# Altium project QKD-LD-002.PrjPcb
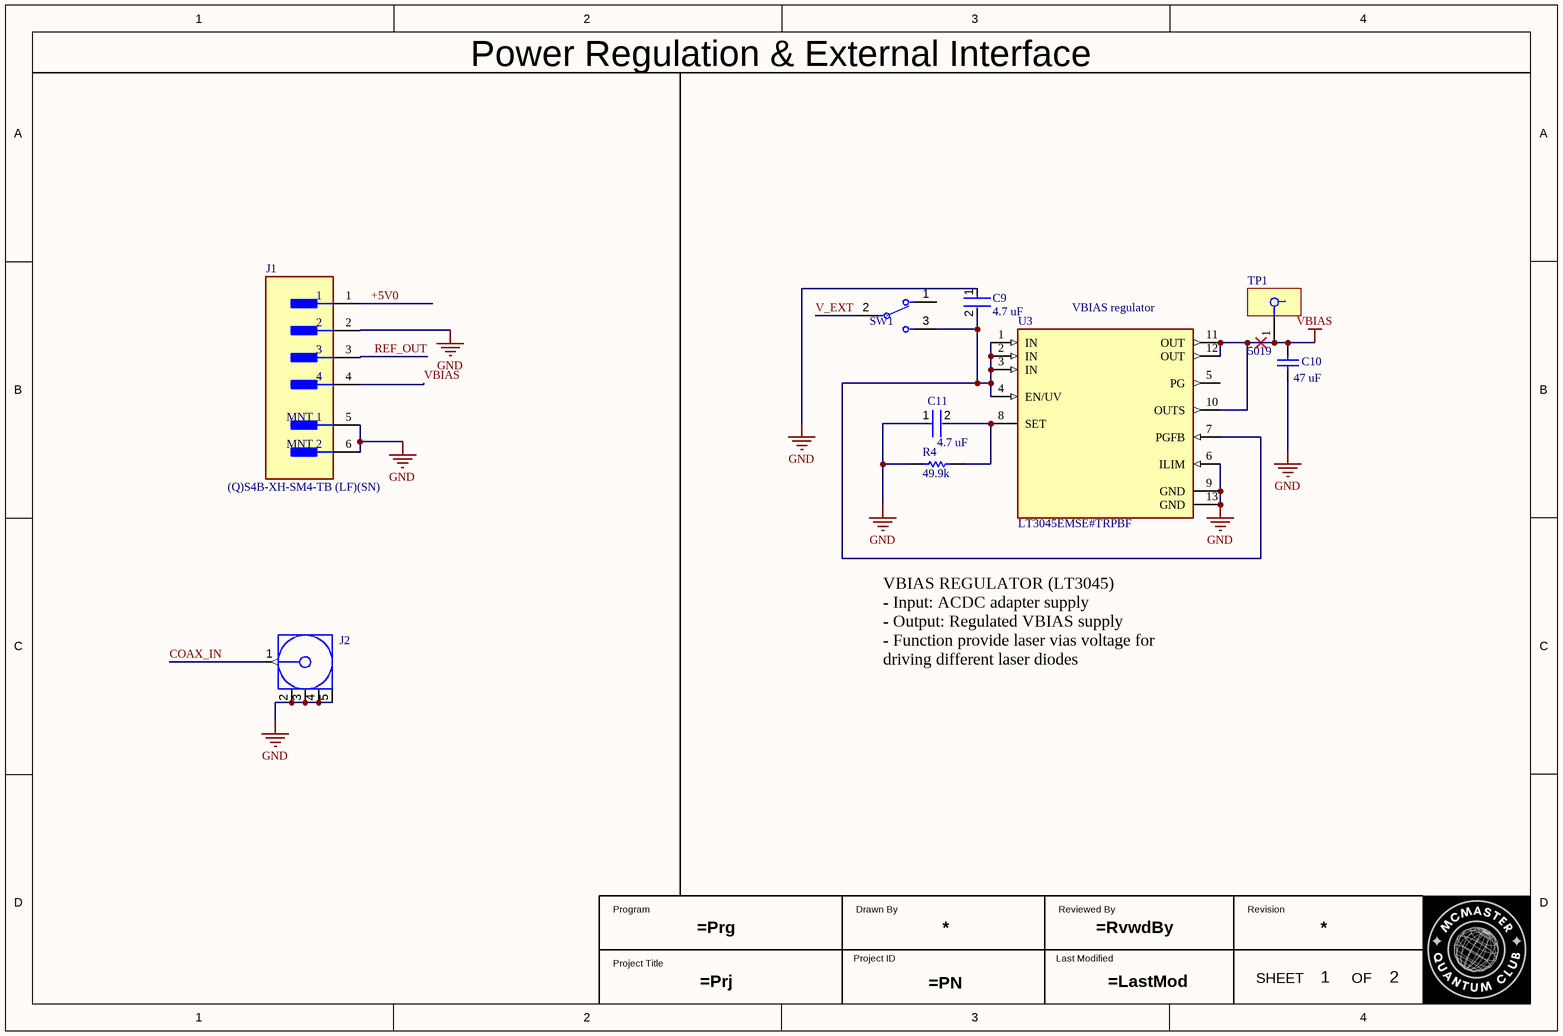
[diagram p0: Power Regulation and Interfaces.SchDoc]
2 sheets, 24 parts. Net scope: global (net labels, ports and power ports of the same name join across sheets).
Sheets:
  Power Regulation and Interfaces.SchDoc
  Laser Driver.SchDoc

## Sheet Power Regulation and Interfaces.SchDoc
size A4; SheetNumber: 1; SheetTotal: 2; SPICEModelCacheAAATKUSZ: <root> / <DocumentId>AAATKUSZ</DocumentId> / <CacheFrame Number="0"> / <Model Name="emk325b7475_nht" Kind="CKT"> / <Text>* EMK325B7475_NHT     SPICE MODEL  ( General Type ) / *-------------------------------------------------------------------------------------------------------- / * Model Generated by TAIYO YUDEN Corporation (http://www.ty-top.com) / * Version 1.0 / * TAIYO YUDEN Control No. 170613 / * Copyright(c) 2017 TAIYO YUDEN CO.,LTD. All Rights Reserved. / *-------------------------------------------------------------------------------------------------------- / * / * Products Name : Multilayer Ceramic Capacitors / * / * Characteristics : / *     Capacitance : 4.7 uF , Rated Voltage : 16V , TCC : X7R / *     Case Size : 3.2 x 2.5 / 0.126 x 0.098 [mm/inch] , Thickness : 1.9 / 0.075 [mm/inch] / *     (Conditions: Temperature = 25 degC , DC Bias Current/Voltage = 0A / 0V) / * / * Frequency Range : 40Hz - 3GHz / * / * External Node Assignments : / * / *  1  o---| |---o  2 / * / *-------------------------------------------------------------------------------------------------------- / .SubCkt EMK325B7475_NHT 1 2 / **************************** / C0 1 110 4.4322u / Cm 1 101 0.18549u / C1 101 102 0.5166u / Rc1 101 102 1.212k / C2 102 103 0.23246u / Rc2 102 103 324.4 / C3 103 110 0.044161u / Rc3 103 110 17.632 / C2m 1 301 0.22169u / C21 301 302 1.4263u / Rc21 301 302 2.8865k / C22 302 303 0.94554u / Rc22 302 303 3.6708k / C23 303 304 0.89694u / Rc23 303 304 3.8182k / C24 304 305 0.63775u / Rc24 304 305 327.79 / C25 305 306 0.52201u / Rc25 305 306 313.07 / C26 306 307 0.23625u / Rc26 306 307 60.171 / C27 307 308 0.21382u / Rc27 307 308 30.452 / C28 308 309 0.12573u / Rc28 308 309 51.023 / C29 309 110 4272.8p / Rc29 309 110 13.367 / Rp0 1 110 106.382978723404Meg / L0 110 120 0.15544n / Lm 120 130 0.41806n / L1 120 121 0.46753n / RL1 121 130 0.26517 / L2 120 122 0.47905n / RL2 122 130 0.25841 / L3 120 123 0.81633n / RL3 123 130 40.755 / CR 120 124 1.2488u / LR 124 125 0.3236n / RR 125 130 24.837m / CL 130 140 3.3935p / LL 130 140 0.14146n / RL 130 140 14.873 / Rs 140 2 4.0745m / **************************** / .ends EMK325B7475_NHT</Text> / </Model> / </CacheFrame> / </root>

### Parts
C9  4.7 uF  [FP-1210-L_3_2_0_3-W_2_5_0-MFG]
C10  47 uF  [WCAP-CSGP_1206_L3.2W1.6H1.6]
C11  4.7 uF  [FP-1210-L_3_2_0_3-W_2_5_0-MFG]
J1  (Q)S4B-XH-SM4-TB (LF)(SN)  [FP-Q_S4B-XH-SM4-TB_LF-MFG]
J2  60312242114510  [60312242114510]  (value not drawn)
R4  49.9k  [RESC1005X40X25NL05T05]
SW1  JS102011SAQN  [FP-JS102011SAQN-MFG]  (value not drawn)
TP1  5019  [5019_MFG]
U3  LT3045EMSE#TRPBF  [FP-MSE-12-05-08-1666-IPC_B]

### Nets
+5V0: C9.1 C10.1 C11.1 J1.1 J1.2 J1.5(MNT_1) J1.6(MNT_2) J2.2(GND) J2.3(GND) J2.4(GND) J2.5(GND) R4.1 U3.6(ILIM) U3.9(GND) U3.13(GND)  [also labelled GND]
VBIAS: C10.2 J1.4 TP1.1 U3.10(OUTS) U3.11(OUT) U3.12(OUT)
COAX_IN: J2.1(Signal)
REF_OUT: J1.3
V_EXT: SW1.2(C)
NetC9_2: C9.2 SW1.3 U3.1(IN) U3.2(IN) U3.3(IN) U3.4(EN/UV) U3.7(PGFB)
NetC11_2: C11.2 R4.2 U3.8(SET)

Not connected (* = marked no-connect by the designer): SW1 1; U3 5(PG)

### Notes on the sheet
- Power Regulation & External Interface
- (near U3) VBIAS regulator
- Type @ to refer to a designator
- VBIAS REGULATOR (LT3045)
  - Input: ACDC adapter supply
  - Output: Regulated VBIAS supply
  - Function provide laser vias voltage for driving different laser diodes
- Program
- Drawn By
- Reviewed By
- Revision
- Project Title
- Project ID
- Last Modified
- SHEET
- OF

### Library data of the parts
C9 C11 = CMP-14477-002952-2: None; RoHS Compliant: Yes
C10 = CMP-03913-65419936-2: 4.7μF ±10% 25V Ceramic Capacitor X7R 1206 (3216 Metric); Insulation Resistance: 100MΩ; Mount: Surface Mount; Tolerance: 10%; Min Operating Temperature: -55°C; Case Code (Imperial): 1206; RoHS: Compliant; Case Code (Metric): 3216; Case/Package: 1206; Voltage Rating: 25V; Length: 3.2mm; Capacitance: 4.7µF; Thickness: 1.905mm; Height: 1.6mm; Max Operating Temperature: 125°C; Width: 1.6mm
J1 = CMP-17439-000477-1: CONN HEADER SMD R/A 4POS 2.5MM
J2 = CMP-03913-97004434-3: Rf Coax Conn, Sma Jack, 50 Ohm, Pcb Rohs Compliant: Yes; Insertion Loss (dB): 0.14dB; Impedance: 50Ω; Insulation Resistance: 5GΩ; Orientation: Straight; Connector Type: SMA; Max Operating Temperature: 165°C; Insulation Material: PTFE; Min Operating Temperature: -65°C
R4 = CMP-2002-00036-1: Manufacturer: Vishay Dale; Part Number: CRCW0402499KFKTD
SW1 = CMP-2000-06501-2: SWITCH SLIDE SPDT 300MA 6V; Switch Function: On-On; Illumination Type: Non-Illuminated; Switch Travel: 2mm; Contact Resistance: 70mR; Actuator Material: Nylon; Electrical Life: 5000Cycles; Actuator Type: Standard; Max Operating Temperature: 85°C; Housing Material: Nylon; Radiation Hardening: No; Max Voltage Rating (DC): 6V; Package Quantity: 1; Case/Package: 100; Actuator Length: 2mm; Min Operating Temperature: -40°C; Contact Current Rating: 300mA; REACH SVHC: No SVHC; Throw Configuration: SPDT; Packaging: Tape and Reel; Contact Material: Copper Alloy; Max Current Rating: 300mA; Current Rating: 300mA; Mount: Surface Mount; Lead Free: Lead Free; Termination: Gull Wing; Voltage Rating (DC): 6V; Length: 9mm; Orientation: Right Angle; Contact Plating: Silver
TP1 = CMP-1672-00008-3: Phosphor Bronze Contact Miniature Silver Plated Surface Mount Test Points; Number of Contacts: 1; ComponentLink1Description: Manufacturer's Website; Number of Pins: 1; Height: 2.42mm; Mount: Surface Mount; HelpURL: https://www.keyelco.com/product-pdf.cfm?p=1357; REACH SVHC: Yes; Packaging: Tape and Reel; Lead Free: Lead Free; ComponentLink1URL: http://www.keyelco.com/; Termination: SMD/SMT; Material: Bronze; Contact Plating: Silver; Contact Material: Silver; RoHS: Compliant; ComponentLink2URL: https://www.keyelco.com/product-pdf.cfm?p=1357; China RoHS: Compliant; Lifecycle Status: Production; ComponentLink2Description: Datasheet URL
U3 = CMP-09138-000053-1: IC REG LINEAR 0V 500MA 12MSOP; Case/Package: MSOP; RoHS Compliant: Yes

## Sheet Laser Driver.SchDoc
size A4; DrawnBy: AS; Revision: 1.0; SheetNumber: 2; SheetTotal: 1; Prg: Quantum Key Distribution; PrJ: Laser Driver; PN: QKD-LD-002; LastMod: Oct. 27, 2026
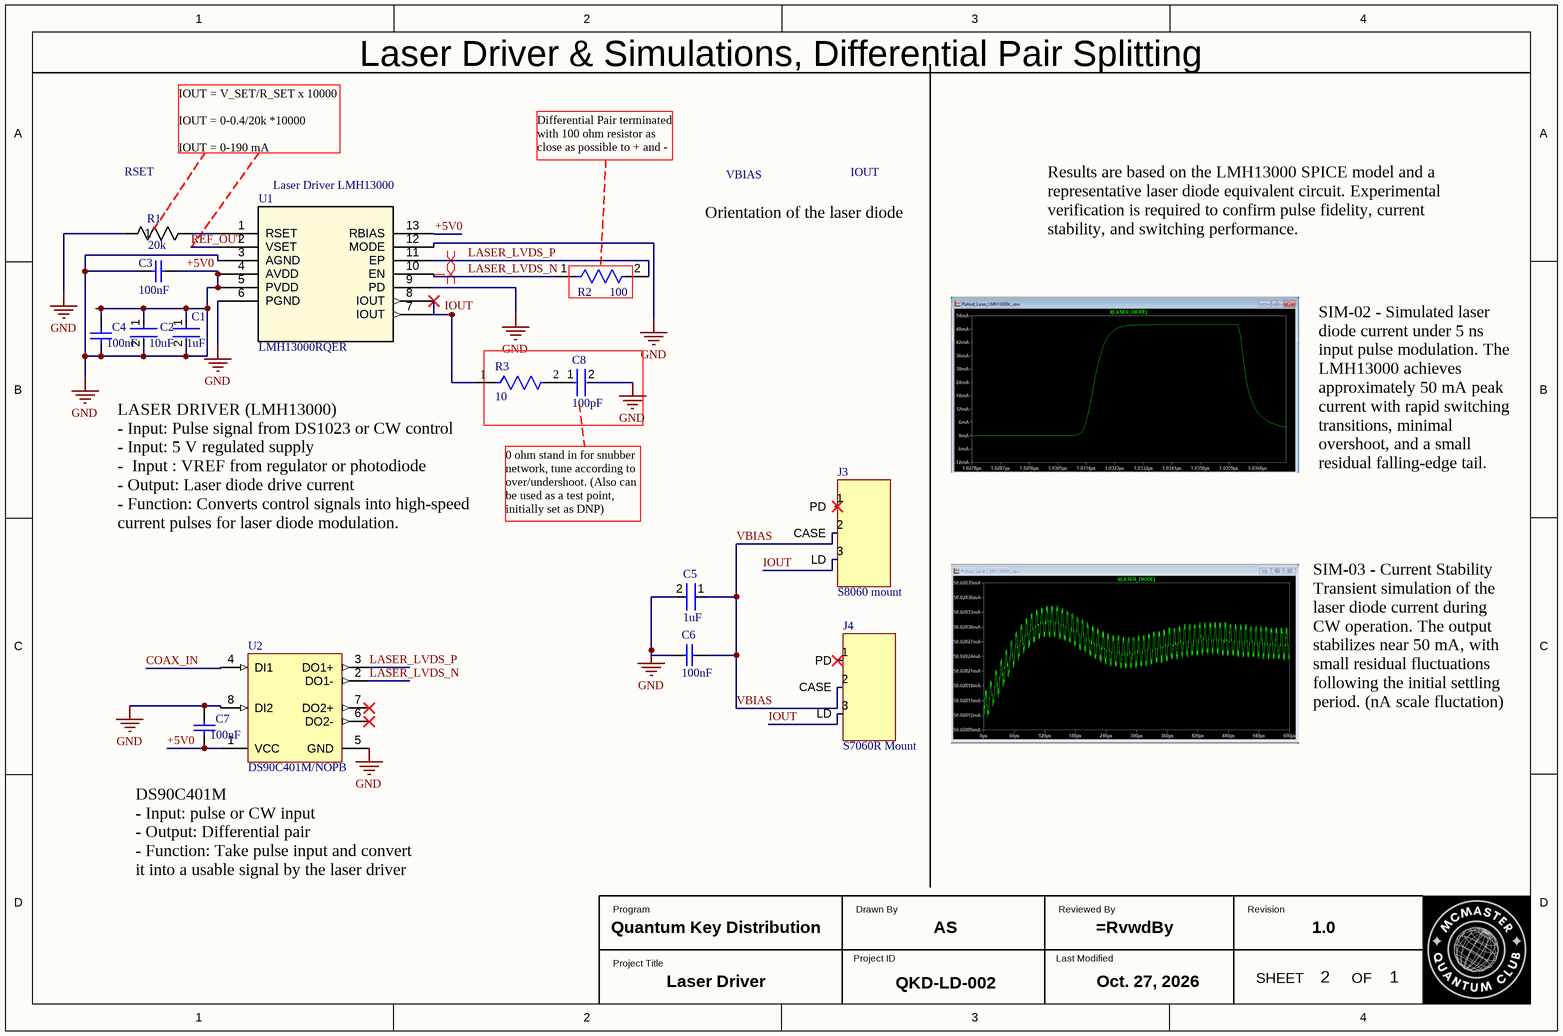
[diagram p1: Laser Driver.SchDoc]

### Parts
C1  1uF  [FP-1206-L_3_2_0_15-W_1_6-IPC_A]
C2  10uF  [FP-GCJ31C-0_4-IPC_C]
C3  100nF  [CAPC2013X145X50LL20T20]
C4  100nF  [CAPC2013X145X50LL20T20]
C5  1uF  [FP-1206-L_3_2_0_15-W_1_6-IPC_A]
C6  100nF  [CAPC2013X145X50LL20T20]
C7  100nF  [CAPC2013X145X50LL20T20]
C8  100pF  [FP-KCA55L-6_1_5_1_3_0_9-C-MFG]
J3  S8060 mount  [PCBComponent_1]
J4  S7060R Mount  [PCBComponent_1]
R1  20k  [MCA 1206_VIS]
R2  100  [FP-MCS0402-IPC_B]
R3  10  [FP-TFCR0603-IPC_B]
U1  LMH13000RQER  [XLMH13000RQER.A_WQFN-HR_TXI_TEX]
U2  DS90C401M/NOPB  [D0008A_N]

### Nets
+5V0: C1.1 C1.2 C2.1 C2.2 C3.1 C3.2 C4.1 C4.2 C5.2 C6.1 C7.1 C7.2 C8.2 R1.1 U1.3(AGND) U1.4(AVDD) U1.5(PVDD) U1.6(PGND) U1.9(PD) U1.12(MODE) U1.13(RBIAS) U2.1(VCC) U2.5(GND) U2.8(DI2)  [also labelled GND]
VBIAS: C5.1 C6.2 J3.2(CASE) J4.2(CASE)
\: R2.1 U1.10(EN) U2.2(DO1-)  [also labelled LASER_LVDS_N]
COAX_IN: U2.4(DI1)
IOUT: J3.3(LD) J4.3(LD)
LASER_LVDS_P: R2.2 U1.11(EP) U2.3(DO1+)
REF_OUT: U1.2(VSET)
NetC8_1: C8.1 R3.2
NetR1_2: R1.2 U1.1(RSET)
NetR3_1: R3.1 U1.7(IOUT)

Not connected (* = marked no-connect by the designer): J3 1(PD)*; J4 1(PD)*; U1 8(IOUT)*; U2 6(DO2-)* 7(DO2+)*

### Layout directives
differential pair: \, LASER_LVDS_P

### Notes on the sheet
- Laser Driver & Simulations, Differential Pair Splitting
- RSET
- IOUT = V_SET/R_SET x 10000
  IOUT = 0-0.4/20k *10000
  IOUT = 0-190 mA
- Differential Pair terminated with 100 ohm resistor as close as possible to + and -
- VBIAS
- IOUT
- (near U1) Laser Driver LMH13000
- Orientation of the laser diode
- Results are based on the LMH13000 SPICE model and a representative laser diode equivalent circuit. Experimental verification is required to confirm pulse fidelity, current stability, and switching performance.
- 0 ohm stand in for snubber network, tune according to over/undershoot. (Also can be used as a test point, initially set as DNP)
- SIM-02 - Simulated laser diode current under 5 ns input pulse modulation. The LMH13000 achieves approximately 50 mA peak current with rapid switching transitions, minimal overshoot, and a small residual falling-edge tail.
- (near R3) LASER DRIVER (LMH13000)
  - Input: Pulse signal from DS1023 or CW control
  - Input: 5 V regulated supply
  -  Input : VREF from regulator or photodiode
  - Output: Laser diode drive current
  - Function: Converts control signals into high-speed current pulses for laser diode modulation.
- Type @ to refer to a designator
- SIM-03 - Current Stability
  Transient simulation of the laser diode current during CW operation. The output stabilizes near 50 mA, with small residual fluctuations following the initial settling period. (nA scale fluctation)
- DS90C401M
  - Input: pulse or CW input
  - Output: Differential pair
  - Function: Take pulse input and convert it into a usable signal by the laser driver
- Labels drawn without touching a wire or pin: IOUT
- Program
- Drawn By
- Reviewed By
- Revision
- Project Title
- Project ID
- Last Modified
- SHEET
- OF

### Library data of the parts
C1 C5 = CMP-14477-003123-2: None
C2 = CMP-06035-004889-1: Cap Ceramic 10uF 35V X7T 10% SMD 1206 +125°C Embossed Plastic T/R
C3 C4 C6 C7 = CMP-2007-01396-1: Part Number: VJ0805Y104JXXPW1BC; Manufacturer: Vitramon
C8 = CMP-06035-061656-1: Metal Terminal Type Multilayer Ceramic Capacitors 100pF ±10% 250Vac(r.m.s.) U2J -750±120ppm/℃ AEC-Q200 SMD2
J3 J4 = Component_1
R1 = CMP-00030-44469054-1: MCA12060D2002BP500 SMD Chip Resistor, 20 kOhm, ± 0.1%, 250 mW, 1206 [3216 Metric], Thin Film, Precision; Resistance: 20kΩ; Temperature Coefficient: 25ppm/°C; Power Rating: 250mW; Voltage Rating: 200V; RoHS: Compliant; NexarPartId: 44469054; Lead Free: Lead Free; Composition: Thin Film; Tolerance: 0.1%; Min Operating Temperature: -55°C; Max Operating Temperature: 125°C; Depth: 1.6mm; Packaging: Tape and Reel; Military Standard: Not; Height: 650µm; Width: 1.6mm; Case/Package: 1206; Length: 3.2mm
R2 = CMP-02407-000612-1: RES SMD 1.2K OHM 1% 1/10W 0402; Resistance: 100R; Tolerance: 0.1%; Power Rating: 63mW; Temperature Coefficient: 25ppm/°C; Voltage Rating: 50V; Length: 1mm; Width: 0.5mm; Min Operating Temperature: -55°C; Height: 0.32mm; Composition: Thin Film; Case/Package: 0402; Case Code (Imperial): 0402; Packaging: Tape and Reel; Weight: 2.1E-05oz; Case Code (Metric): 1005; Max Operating Temperature: 155°C; Termination: SMD/SMT; Contact Plating: Tin
R3 = CMP-250906-269177-1: RES Thin Film,  10Ω, 0.5%, 0.1W, 50ppm/°C, 0603
U1 = LMH13000RQER: High-speed, voltage-controlled current output driver 13-WQFN-HR -40 to 125; Manufacturer_Name: Texas Instruments; Copyright: Copyright (C) 2025 Ultra Librarian. All rights reserved.; Manufacturer_Part_Number: LMH13000RQER; RefDes: RefDes; Type: Type
U2 = CMP-0058-00916-3: Dual Low Voltage Differential Signaling (LVDS) Driver, 8 pin SOIC NARROW; Manufacturer: Texas Instruments; CompType: Interface IC; PowerWise: N; PackageTopMarking: NSZXTT*DS90C*401M; RoHS: Y; PackageReference: D0008A; PackageDescription: SOIC Narrow, 4.9 x 3.9 x 1.45mm, 8 Lead, 1.27mm Pitch; ComponentLink1Description: Datasheet URL; Code_IPC: SOIC127P600-8; ComponentLink1URL: http://www.ti.com/general/docs/lit/getliterature.tsp?genericPartNumber=DS90C401&fileType=pdf; Code_JEDEC: MS-012-AA; PinCount: 8

## Nets that join several sheets
+5V0: Power Regulation and Interfaces (15 pins), Laser Driver (24 pins)
VBIAS: Power Regulation and Interfaces (6 pins), Laser Driver (C5.1 C6.2 J3.2 J4.2)
COAX_IN: Power Regulation and Interfaces (J2.1), Laser Driver (U2.4)
REF_OUT: Power Regulation and Interfaces (J1.3), Laser Driver (U1.2)

## Assembly variants
Assembly: not fitted C8 R3